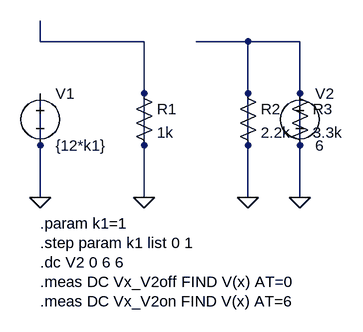
[diagram p0: schematic Ex12.asc]
Ex12.asc, the LTspice schematic file:
Version 4
SHEET 1 1680 1080
WIRE 80 160 80 128
WIRE 240 160 80 160
WIRE 400 160 320 160
WIRE 480 160 400 160
WIRE 240 240 240 160
WIRE 400 240 400 160
WIRE 80 320 80 240
WIRE 240 320 240 240
WIRE 400 320 400 240
WIRE 480 320 480 160
WIRE 80 400 80 320
WIRE 240 400 240 320
WIRE 400 400 400 320
WIRE 480 400 480 320
FLAG 80 400 0
FLAG 240 400 0
FLAG 400 400 0
FLAG 480 400 0
SYMBOL voltage 80 224 R0
WINDOW 123 0 0 Left 0
WINDOW 39 0 0 Left 0
SYMATTR InstName V1
SYMATTR Value {12*k1}
SYMBOL voltage 480 224 R0
WINDOW 123 0 0 Left 0
WINDOW 39 0 0 Left 0
SYMATTR InstName V2
SYMATTR Value 6
SYMBOL res 224 224 R0
SYMATTR InstName R1
SYMATTR Value 1k
SYMBOL res 384 224 R0
SYMATTR InstName R2
SYMATTR Value 2.2k
SYMBOL res 464 224 R0
SYMATTR InstName R3
SYMATTR Value 3.3k
NET 240 160 a
NET 480 160 b
NET 400 160 x
TEXT 80 440 Left 2 !.param k1=1
TEXT 80 470 Left 2 !.step param k1 list 0 1
TEXT 80 500 Left 2 !.dc V2 0 6 6
TEXT 80 530 Left 2 !.meas DC Vx_V2off FIND V(x) AT=0
TEXT 80 560 Left 2 !.meas DC Vx_V2on FIND V(x) AT=6

The netlist it stands for:
* Ex12.asc
V1 0 0 {12*k1}
V2 0 0 6
R1 0 0 1k
R2 0 0 2.2k
R3 0 0 3.3k
.param k1=1
.step param k1 list 0 1
.dc V2 0 6 6
.meas DC Vx_V2off FIND V(x) AT=0
.meas DC Vx_V2on FIND V(x) AT=6
.backanno
.end